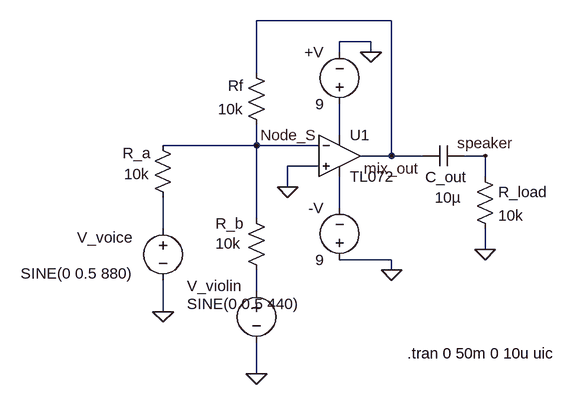
[diagram p0: schematic mixer.asc]
* mixer.asc
* U1: TL072 (symbol TL072 not available, pins judged from their places): In+=0 In-=Node_S V+=N001 V-=N002 OUT=mix_out
V§+V N001 0 9
V§-V 0 N002 9
V_voice N003 0 SINE(0 0.5 880)
V_violin N004 0 SINE(0 0.5 440)
R_a Node_S N003 10k
R_b Node_S N004 10k
Rf Node_S mix_out 10k
C_out speaker mix_out 10µ
R_load speaker 0 10k
.tran 0 50m 0 10u uic
.backanno
.end

* Results of the author's LTspice run, read from the files saved beside the schematic
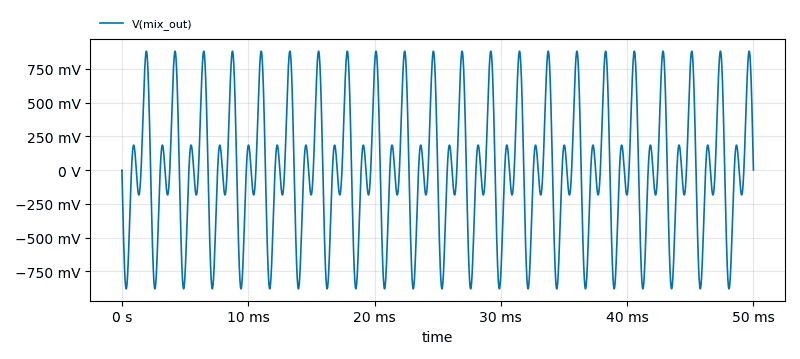
[diagram p1: Transient Analysis of mixer.asc, plotted from the saved traces]
* Transient Analysis, 1 run:
*   V(mix_out): min -880 mV, max 880.1 mV, average 33.3 µV, rms 500 mV, last 625 µV